# Altium schematic sheet Controller-Driver-Sheet-4.SchDoc (part 1 of 3)
size 420 x 297 mm; SheetNumber: 13; SheetTotal: 15
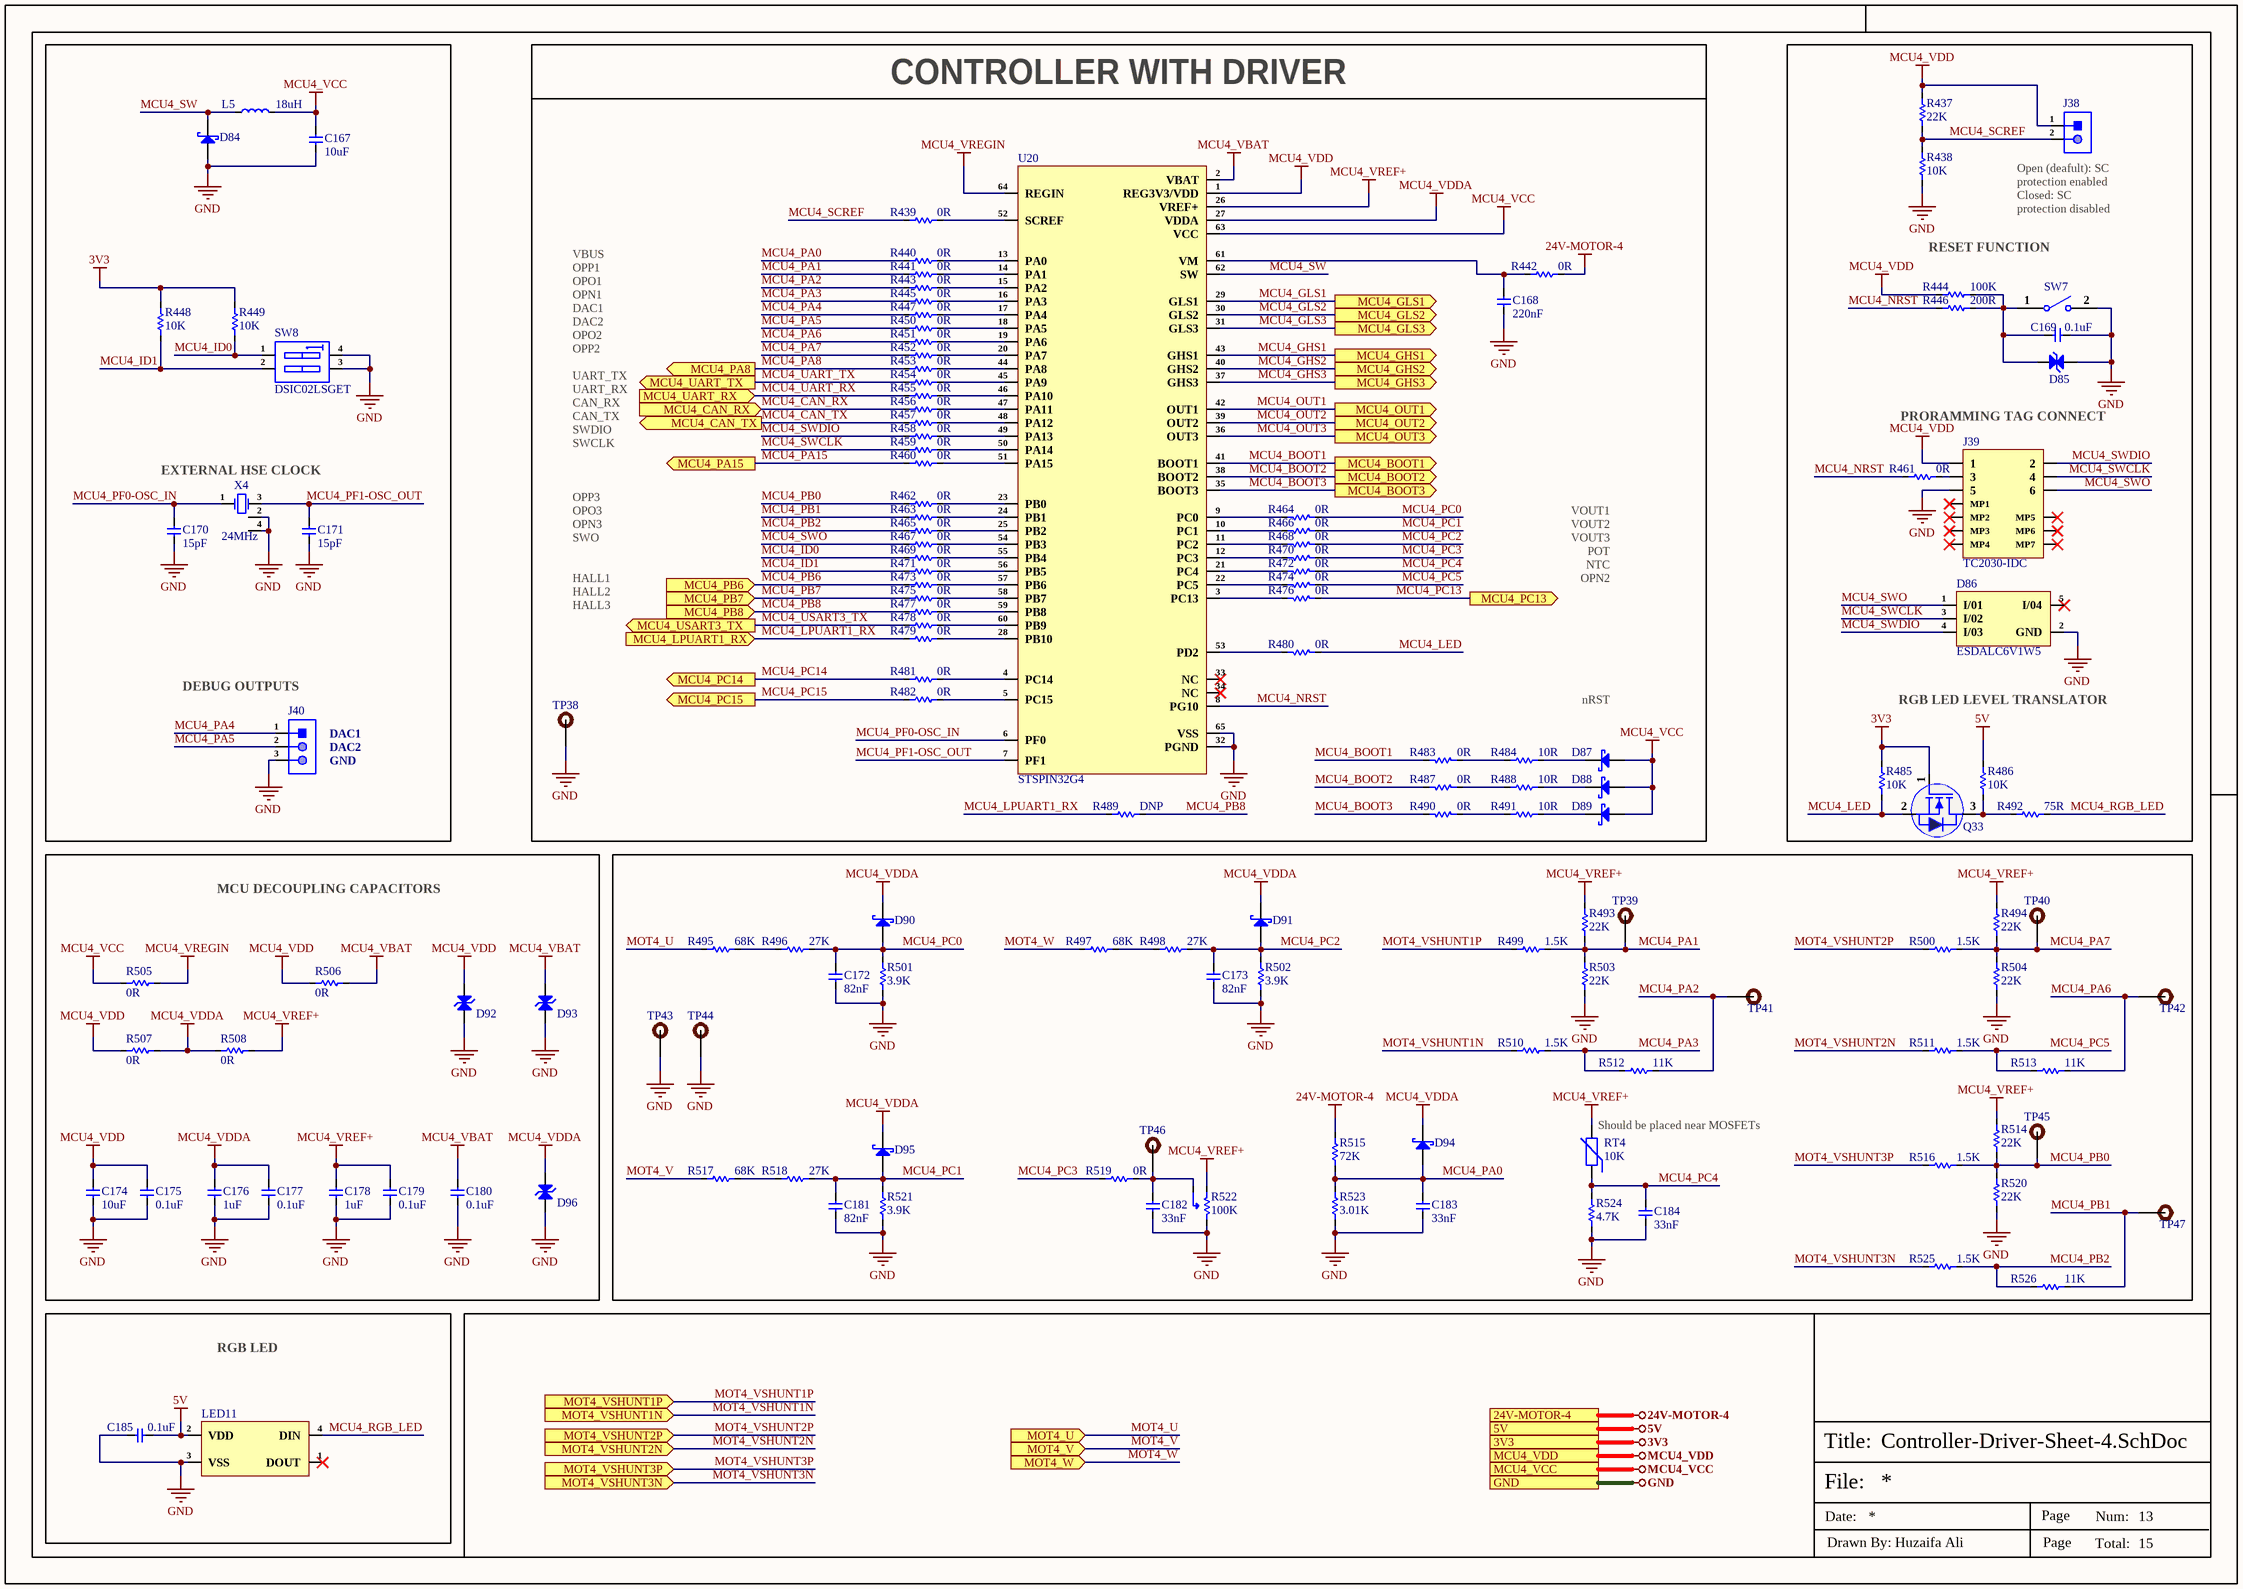
[diagram p0: Controller-Driver-Sheet-4.SchDoc]

## Parts
C167  10uF  [Cap-0805]
C168  220nF  [Cap-0805]
C169  0.1uF  [Cap-0402]
C170  15pF  [Cap-0201]
C171  15pF  [Cap-0201]
C172  82nF  [Cap-0603]
C173  82nF  [Cap-0603]
C174  10uF  [Cap-0603]
C175  0.1uF  [Cap-0402]
C176  1uF  [Cap-0402]
C177  0.1uF  [Cap-0402]
C178  1uF  [Cap-0402]
C179  0.1uF  [Cap-0402]
C180  0.1uF  [Cap-0402]
C181  82nF  [Cap-0603]
C182  33nF  [Cap-0603]
C183  33nF  [Cap-0603]
C184  33nF  [Cap-0603]
C185  0.1uF  [Cap-0402]
D84  STPS1H100A  [SMA]  (value not drawn)
D85  ESDM2033MX4T5G  [DFN-2(0.3x0.6)]  (value not drawn)
D86  ESDALC6V1W5  [SOT-323-5]
D87  BAT46ZFILM  [SOD-123]  (value not drawn)
D88  BAT46ZFILM  [SOD-123]  (value not drawn)
D89  BAT46ZFILM  [SOD-123]  (value not drawn)
D90  BAT30KFILM  [SOD-523]  (value not drawn)
D91  BAT30KFILM  [SOD-523]  (value not drawn)
D92  ESDM2033MX4T5G  [DFN-2(0.3x0.6)]  (value not drawn)
D93  ESDM2033MX4T5G  [DFN-2(0.3x0.6)]  (value not drawn)
D94  BAT30KFILM  [SOD-523]  (value not drawn)
D95  BAT30KFILM  [SOD-523]  (value not drawn)
D96  ESDM2033MX4T5G  [DFN-2(0.3x0.6)]  (value not drawn)
J38  X6511WV-02H-C60D30  [HDR1X2_]  (value not drawn)
J39  TC2030-IDC  [TC2030-IDC_]
J40  X6511WV-03H-C60D30  [HDR1X3_]  (value not drawn)
L5  18uH  [FNR5040S180MT]
LED11  WS2812D-F5  [WS2812D-F5]  (value not drawn)
Q33  Si2302CDS  [Sot-23]  (value not drawn)
R437  22K  [Res-0402]
R438  10K  [Res-0402]
R439  0R  [Res-0402]
R440  0R  [Res-0402]
R441  0R  [Res-0402]
R442  0R  [Res-0805]
R443  0R  [Res-0402]
R444  100K  [Res-0402]
R445  0R  [Res-0402]
R446  200R  [Res-0402]
R447  0R  [Res-0402]
R448  10K  [Res-0402]
R449  10K  [Res-0402]
R450  0R  [Res-0402]
R451  0R  [Res-0402]
R452  0R  [Res-0402]
R453  0R  [Res-0402]
R454  0R  [Res-0402]
R455  0R  [Res-0402]
R456  0R  [Res-0402]
R457  0R  [Res-0402]
R458  0R  [Res-0402]
R459  0R  [Res-0402]
R460  0R  [Res-0402]
R461  0R  [Res-0402]
R462  0R  [Res-0402]
R463  0R  [Res-0402]
R464  0R  [Res-0402]
R465  0R  [Res-0402]
R466  0R  [Res-0402]
R467  0R  [Res-0402]
R468  0R  [Res-0402]
R469  0R  [Res-0402]
R470  0R  [Res-0402]
R471  0R  [Res-0402]
R472  0R  [Res-0402]
R473  0R  [Res-0402]
R474  0R  [Res-0402]
R475  0R  [Res-0402]
R476  0R  [Res-0402]
R477  0R  [Res-0402]
R478  0R  [Res-0402]
R479  0R  [Res-0402]
R480  0R  [Res-0402]
R481  0R  [Res-0402]
R482  0R  [Res-0402]
R483  0R  [Res-0402]
R484  10R  [Res-0603]
R485  10K  [Res-0402]
R486  10K  [Res-0402]
R487  0R  [Res-0402]
R488  10R  [Res-0603]
R489  DNP  [Res-0402]
R490  0R  [Res-0402]
R491  10R  [Res-0603]
R492  75R  [Res-0402]
R493  22K  [Res-0402]
R494  22K  [Res-0402]
R495  68K  [Res-0603]
R496  27K  [Res-0603]
R497  68K  [Res-0603]
R498  27K  [Res-0603]
R499  1.5K  [Res-0402]
R500  1.5K  [Res-0402]
R501  3.9K  [Res-0603]
R502  3.9K  [Res-0603]
R503  22K  [Res-0402]
R504  22K  [Res-0402]
R505  0R  [Res-0805]
R506  0R  [Res-0805]
R507  0R  [Res-0805]
R508  0R  [Res-0805]
R510  1.5K  [Res-0402]
R511  1.5K  [Res-0402]
R512  11K  [Res-0402]
R513  11K  [Res-0402]
R514  22K  [Res-0402]
R515  72K  [Res-0603]
R516  1.5K  [Res-0402]
R517  68K  [Res-0603]
R518  27K  [Res-0603]
R519  0R  [Res-0805]
R520  22K  [Res-0402]
R521  3.9K  [Res-0603]
R522  100K  [3386P-1-104TLF]
R523  3.01K  [Res-0603]
R524  4.7K  [Res-0402]
R525  1.5K  [Res-0402]
R526  11K  [Res-0402]
RT4  10K  [Res-0603]
SW7  B3U-1000P  [B3U-1000P]  (value not drawn)
SW8  DSIC02LSGET  [DSIC02LSGET]
TP38  TEST POINT  [Test-point]  (value not drawn)  (no BOM)
TP39  TEST POINT  [Test-point]  (value not drawn)  (no BOM)
TP40  TEST POINT  [Test-point]  (value not drawn)  (no BOM)
TP41  TEST POINT  [Test-point]  (value not drawn)  (no BOM)
TP42  TEST POINT  [Test-point]  (value not drawn)  (no BOM)
TP43  TEST POINT  [Test-point]  (value not drawn)  (no BOM)
TP44  TEST POINT  [Test-point]  (value not drawn)  (no BOM)
TP45  TEST POINT  [Test-point]  (value not drawn)  (no BOM)
TP46  TEST POINT  [Test-point]  (value not drawn)  (no BOM)
TP47  TEST POINT  [Test-point]  (value not drawn)  (no BOM)
U20  STSPIN32G4  [64-VFQFPN 9X9]
X4  24MHz  [SMD2016-4P]

## Blocks framed on the sheet
CONTROLLER WITH DRIVER: C168 D87-D89 R439-R443 R445 R447 R450-R460 R462-R484 R487-R491 TP38 U20
MCU DECOUPLING CAPACITORS: C174-C180 D92 D93 D96 R505-R508
Should be placed near MOSFETs: C172 C173 C181-C184 D90 D91 D94 D95 R493-R504 R510-R526 RT4 TP39-TP47
RGB LED: C185 LED11

## Ports
3V3, 5V, 24V-MOTOR-4, GND, MCU4_BOOT1 (out), MCU4_BOOT2 (out), MCU4_BOOT3 (out), MCU4_CAN_RX (in), MCU4_CAN_TX (out), MCU4_GHS1 (out), MCU4_GHS2 (out), MCU4_GHS3 (out), MCU4_GLS1 (out), MCU4_GLS2 (out), MCU4_GLS3 (out), MCU4_LPUART1_RX (in), MCU4_OUT1 (out), MCU4_OUT2 (out), MCU4_OUT3 (out), MCU4_PA8 (out), MCU4_PA15 (out), MCU4_PB6 (in), MCU4_PB7 (in), MCU4_PB8 (in), MCU4_PC13 (out), MCU4_PC14 (out), MCU4_PC15 (out), MCU4_UART_RX (in), MCU4_UART_TX (out), MCU4_USART3_TX (out), MCU4_VCC, MCU4_VDD, MOT4_U (in), MOT4_V (in), MOT4_VSHUNT1N (in), MOT4_VSHUNT1P (in), MOT4_VSHUNT2N (in), MOT4_VSHUNT2P (in), MOT4_VSHUNT3N (in), MOT4_VSHUNT3P (in), MOT4_W (in)

## Nets
3V3: Q33.1(G) R448.2 R449.2 R485.2 ; port 3V3
5V: C185.2 LED11.2(VDD) R486.2 ; port 5V
24V-MOTOR-4: R442.2 R515.2 ; port 24V-MOTOR-4
GND: C167.1 C168.1 C169.1 C170.1 C171.1 C172.1 C173.1 C174.1 C175.1 C176.1 C177.1 C178.1 C179.1 C180.1 C181.1 C182.1 C183.1 C184.1 C185.1 D84.2(A) D85.1(A) D86.2(GND) D92.1(A) D93.1(A) D96.1(A) J39.5 J40.3 LED11.3(VSS) R438.1 R501.1 R502.1 R503.1 R504.1 R520.1 R521.1 R522.3(CW) R523.1 R524.1 SW7.2 SW8.3(A3) SW8.4(B3) TP38.1 TP43.1 TP44.1 U20.32(PGND) U20.65(VSS) X4.2(GND) X4.4(GND) ; port GND
MCU4_VBAT: C180.2 D93.2(A) R506.2 U20.2(VBAT)
MCU4_VCC: C167.2 D87.1(A) D88.1(A) D89.1(A) L5.2 R505.1 U20.63(VCC) ; port MCU4_VCC
MCU4_VDD: C174.2 C175.2 D92.2(A) J38.1 J39.1 R437.2 R444.1 R506.1 R507.1 U20.1(REG3V3/VDD) ; port MCU4_VDD
MCU4_VDDA: C176.2 C177.2 D90.2(K) D91.2(K) D94.2(K) D95.2(K) D96.2(A) R507.2 R508.1 U20.27(VDDA)
MCU4_VREF+: C178.2 C179.2 R493.2 R494.2 R508.2 R514.2 R522.1(CCW) RT4.2 U20.26(VREF+)
MCU4_VREGIN: R505.2 U20.64(REGIN)
MCU4_BOOT1: R483.1 U20.41(BOOT1) ; port MCU4_BOOT1
MCU4_BOOT2: R487.1 U20.38(BOOT2) ; port MCU4_BOOT2
MCU4_BOOT3: R490.1 U20.35(BOOT3) ; port MCU4_BOOT3
MCU4_CAN_RX: R456.2 ; port MCU4_CAN_RX
MCU4_CAN_TX: R457.2 ; port MCU4_CAN_TX
MCU4_GHS1: U20.43(GHS1) ; port MCU4_GHS1
MCU4_GHS2: U20.40(GHS2) ; port MCU4_GHS2
MCU4_GHS3: U20.37(GHS3) ; port MCU4_GHS3
MCU4_GLS1: U20.29(GLS1) ; port MCU4_GLS1
MCU4_GLS2: U20.30(GLS2) ; port MCU4_GLS2
MCU4_GLS3: U20.31(GLS3) ; port MCU4_GLS3
MCU4_ID0: R449.1 R469.2 SW8.1(A1)
MCU4_ID1: R448.1 R471.2 SW8.2(A2)
MCU4_LED: Q33.2(S) R480.2 R485.1
MCU4_LPUART1_RX: R479.2 R489.2 ; port MCU4_LPUART1_RX
MCU4_NRST: R446.1 R461.2 U20.8(PG10)
MCU4_OUT1: U20.42(OUT1) ; port MCU4_OUT1
MCU4_OUT2: U20.39(OUT2) ; port MCU4_OUT2
MCU4_OUT3: U20.36(OUT3) ; port MCU4_OUT3
MCU4_PA0: C183.2 D94.1(A) R440.2 R515.1 R523.2
MCU4_PA1: R441.2 R493.1 R499.2 R503.2 TP39.1
MCU4_PA2: R443.2 R512.2 TP41.1
MCU4_PA3: R445.2 R510.2 R512.1
MCU4_PA4: J40.1 R447.2
MCU4_PA5: J40.2 R450.2
MCU4_PA6: R451.2 R513.2 TP42.1
MCU4_PA7: R452.2 R494.1 R500.2 R504.2 TP40.1
MCU4_PA8: R453.2 ; port MCU4_PA8
MCU4_PA15: R460.2 ; port MCU4_PA15
MCU4_PB0: R462.2 R514.1 R516.2 R520.2 TP45.1
MCU4_PB1: R463.2 R526.2 TP47.1
MCU4_PB2: R465.2 R525.2 R526.1
MCU4_PB6: R473.2 ; port MCU4_PB6
MCU4_PB7: R475.2 ; port MCU4_PB7
MCU4_PB8: R477.2 R489.1 ; port MCU4_PB8
MCU4_PC0: C172.2 D90.1(A) R464.2 R496.2 R501.2
MCU4_PC1: C181.2 D95.1(A) R466.2 R518.2 R521.2
MCU4_PC2: C173.2 D91.1(A) R468.2 R498.2 R502.2
MCU4_PC3: R470.2 R519.1
MCU4_PC4: C184.2 R472.2 R524.2 RT4.1
MCU4_PC5: R474.2 R511.2 R513.1
MCU4_PC13: R476.2 ; port MCU4_PC13
MCU4_PC14: R481.2 ; port MCU4_PC14
MCU4_PC15: R482.2 ; port MCU4_PC15
MCU4_PF0-OSC_IN: C170.2 U20.6(PF0) X4.1(OSC1)
MCU4_PF1-OSC_OUT: C171.2 U20.7(PF1) X4.3(OSC2)
MCU4_RGB_LED: LED11.4(DIN) R492.2
MCU4_SCREF: J38.2 R437.1 R438.2 R439.2
MCU4_SW: D84.1(K) L5.1 U20.62(SW)
MCU4_SWCLK: D86.3(I/02) J39.4 R459.2
MCU4_SWDIO: D86.4(I/03) J39.2 R458.2
MCU4_SWO: D86.1(I/01) J39.6 R467.2
MCU4_UART_RX: R455.2 ; port MCU4_UART_RX
MCU4_UART_TX: R454.2 ; port MCU4_UART_TX
MCU4_USART3_TX: R478.2 ; port MCU4_USART3_TX
MOT4_U: R495.1 ; port MOT4_U
MOT4_V: R517.1 ; port MOT4_V
MOT4_VSHUNT1N: R510.1 ; port MOT4_VSHUNT1N
MOT4_VSHUNT1P: R499.1 ; port MOT4_VSHUNT1P
MOT4_VSHUNT2N: R511.1 ; port MOT4_VSHUNT2N
MOT4_VSHUNT2P: R500.1 ; port MOT4_VSHUNT2P
MOT4_VSHUNT3N: R525.1 ; port MOT4_VSHUNT3N
MOT4_VSHUNT3P: R516.1 ; port MOT4_VSHUNT3P
MOT4_W: R497.1 ; port MOT4_W
NetC168_2: C168.2 R442.1 U20.61(VM)
NetC169_2: C169.2 D85.2(A) R444.2 R446.2 SW7.1
NetC182_2: C182.2 R519.2 R522.2(Wiper) TP46.1
NetD87_2: D87.2(K) R484.2
NetD88_2: D88.2(K) R488.2
NetD89_2: D89.2(K) R491.2
NetJ39_3: J39.3 R461.1
NetQ33_3: Q33.3(D) R486.1 R492.1
NetR439_1: R439.1 U20.52(SCREF)
NetR440_1: R440.1 U20.13(PA0)
NetR441_1: R441.1 U20.14(PA1)
NetR443_1: R443.1 U20.15(PA2)
NetR445_1: R445.1 U20.16(PA3)
NetR447_1: R447.1 U20.17(PA4)
NetR450_1: R450.1 U20.18(PA5)
NetR451_1: R451.1 U20.19(PA6)
NetR452_1: R452.1 U20.20(PA7)
NetR453_1: R453.1 U20.44(PA8)
NetR454_1: R454.1 U20.45(PA9)
NetR455_1: R455.1 U20.46(PA10)
NetR456_1: R456.1 U20.47(PA11)
NetR457_1: R457.1 U20.48(PA12)
NetR458_1: R458.1 U20.49(PA13)
NetR459_1: R459.1 U20.50(PA14)
NetR460_1: R460.1 U20.51(PA15)
NetR462_1: R462.1 U20.23(PB0)
NetR463_1: R463.1 U20.24(PB1)
NetR464_1: R464.1 U20.9(PC0)
NetR465_1: R465.1 U20.25(PB2)
NetR466_1: R466.1 U20.10(PC1)
NetR467_1: R467.1 U20.54(PB3)
NetR468_1: R468.1 U20.11(PC2)
NetR469_1: R469.1 U20.55(PB4)
NetR470_1: R470.1 U20.12(PC3)
NetR471_1: R471.1 U20.56(PB5)
NetR472_1: R472.1 U20.21(PC4)
NetR473_1: R473.1 U20.57(PB6)
NetR474_1: R474.1 U20.22(PC5)
NetR475_1: R475.1 U20.58(PB7)
NetR476_1: R476.1 U20.3(PC13)
NetR477_1: R477.1 U20.59(PB8)
NetR478_1: R478.1 U20.60(PB9)
NetR479_1: R479.1 U20.28(PB10)
NetR480_1: R480.1 U20.53(PD2)
NetR481_1: R481.1 U20.4(PC14)
NetR482_1: R482.1 U20.5(PC15)
NetR483_2: R483.2 R484.1
NetR487_2: R487.2 R488.1
NetR490_2: R490.2 R491.1
NetR495_2: R495.2 R496.1
NetR497_2: R497.2 R498.1
NetR517_2: R517.2 R518.1

Not connected (* = marked no-connect by the designer): D86 5(I/04)*; J39 MP1* MP2* MP3* MP4* MP5* MP6* MP7*; LED11 1(DOUT)*; U20 33(NC)* 34(NC)*

## Notes on the sheet
- VBUS
- OPP1
- RESET FUNCTION
- (near J38) Open (deafult): SC protection enabled
  Closed: SC protection disabled
- OPO1
- OPN1
- DAC1
- DAC2
- OPO2
- OPP2
- UART_TX
- UART_RX
- CAN_RX
- CAN_TX
- SWDIO
- SWCLK
- PRORAMMING TAG CONNECT
- (near X4) EXTERNAL HSE CLOCK
- OPP3
- OPO3
- OPN3
- SWO
- VOUT1
- VOUT2
- VOUT3
- HALL1
- HALL2
- POT
- NTC
- OPN2
- HALL3
- (near J40) DEBUG OUTPUTS
- (near J40) DAC1
- nRST
- RGB LED LEVEL TRANSLATOR
- (near J40) DAC2
- (near J40) GND
- File:
- Title:
- Date:
- Page
- Num:
- Total:
- Drawn By: Huzaifa Ali